# EAGLE design dice_2a (EAGLE 9.7.0)
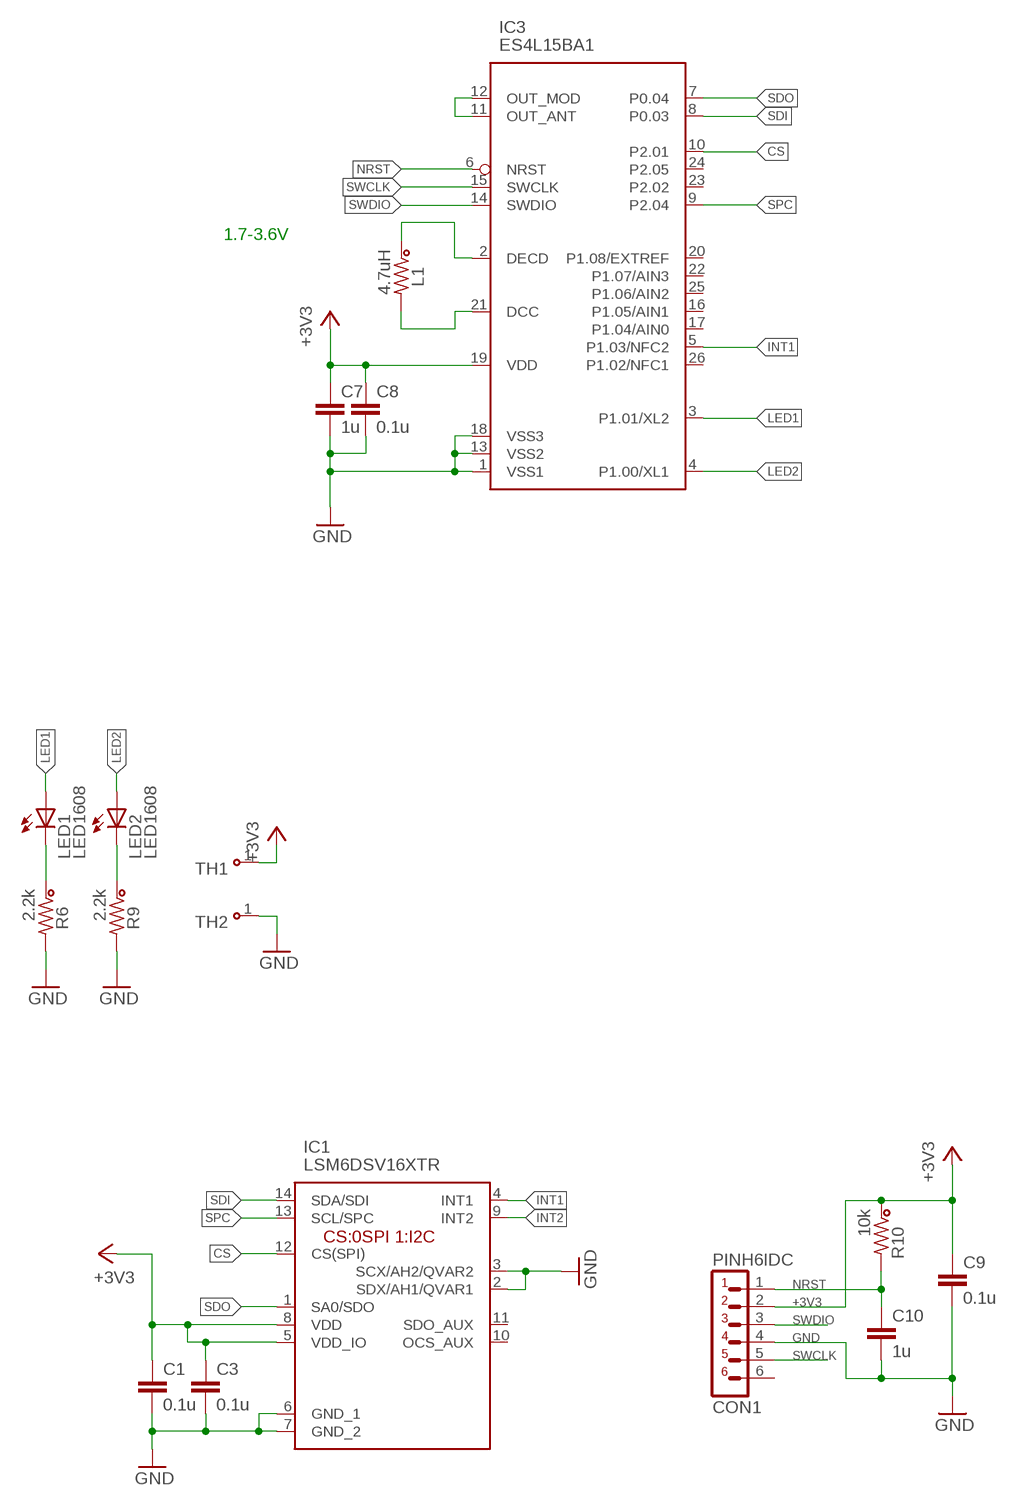
[diagram p0: schematic, sheet 1]

## Parts
C1  0.1u  C-CC1608A  [1608A]
C3  0.1u  C-CC1608A  [1608A]
C7  1u  C-CC1608A  [1608A]
C8  0.1u  C-CC1608A  [1608A]
C9  0.1u  C-CC1608A  [1608A]
C10  1u  C-CC1608A  [1608A]
CON1  PINH6IDC  [1X6IDC_1R27]
IC1  LSM6DSV16XTR  [LSM6DSV16BXTR]
IC3  ES4L15BA1  [ES4L15BA1]
L1  4.7uH  R-CC1608A  [1608A]
LED1  LED1608  [LED1608]
LED2  LED1608  [LED1608]
R6  2.2k  R-CC1608A  [1608A]
R9  2.2k  R-CC1608A  [1608A]
R10  10k  R-CC1608A  [1608A]
TH1  THCHK  [03C]
TH2  THCHK  [03C]

## Nets
+3V3: C1.1 C3.1 C7.1 C8.1 C9.1 CON1.2 IC1.5(VDD_IO) IC1.8(VDD) IC3.19(VDD) R10.1 TH1.1
CS: IC1.12(CS(SPI)) IC3.10(P2.01)
GND: C1.2 C3.2 C7.2 C8.2 C9.2 C10.2 CON1.4 IC1.2(SDX/AH1/QVAR1) IC1.3(SCX/AH2/QVAR2) IC1.6(GND_1) IC1.7(GND_2) IC3.1(VSS1) IC3.13(VSS2) IC3.18(VSS3) R6.2 R9.2 TH2.1
INT1: IC1.4(INT1) IC3.5(P1.03/NFC2)
INT2: IC1.9(INT2)
LED1: IC3.3(P1.01/XL2) LED1.A
LED2: IC3.4(P1.00/XL1) LED2.A
N$1: LED2.K(C) R9.1
N$2: IC3.11(OUT_ANT) IC3.12(OUT_MOD)
N$3: LED1.K(C) R6.1
N$4: IC3.2(DECD) L1.1
N$5: IC3.21(DCC) L1.2
NRST: C10.1 CON1.1 IC3.6(NRST) R10.2
SDI: IC1.14(SDA/SDI) IC3.8(P0.03)
SDO: IC1.1(SA0/SDO) IC3.7(P0.04)
SPC: IC1.13(SCL/SPC) IC3.9(P2.04)
SWCLK: CON1.5 IC3.15(SWCLK)
SWDIO: CON1.3 IC3.14(SWDIO)
Unconnected: CON1.6 IC1.10(OCS_AUX) IC1.11(SDO_AUX) IC3.16(P1.05/AIN1) IC3.17(P1.04/AIN0) IC3.20(P1.08/EXTREF) IC3.22(P1.07/AIN3) IC3.23(P2.02) IC3.24(P2.05) IC3.25(P1.06/AIN2) IC3.26(P1.02/NFC1)

## Notes on the sheet
- 1.7-3.6V

## Library data of the parts
C1 C3 C7-C10 = dac:C-CC
CON1 = dac:PINH6
IC1 = SamacSys_Parts:LSM6DSV16XTR: iNEMO 3D accelerometer and 3D gyroscope: always-on inertial module with embedded machine learning core and Qvar electrostatic sensor Source: Datasheet <https://www.st.com/resource/en/datasheet/lsm6dsv16x.pdf>; PARTS: LSM6DSV320XTR; SHOP: mouser
IC3 = SamacSys_Parts:ES4L15BA1: Board Mount Motion & Position Sensors 9-axis IMU Source: Datasheet <https://www.ceva-dsp.com/wp-content/uploads/2019/10/BNO080_085-Datasheet.pdf>
L1 = dac:R-CC; PARTS: LSQPB160807T4R7M
LED1 LED2 = dac:LED: LED rectangle, 5.7 x 3.2 mm
R6 R9 R10 = dac:R-CC
TH1 TH2 = dac:TH

## Board
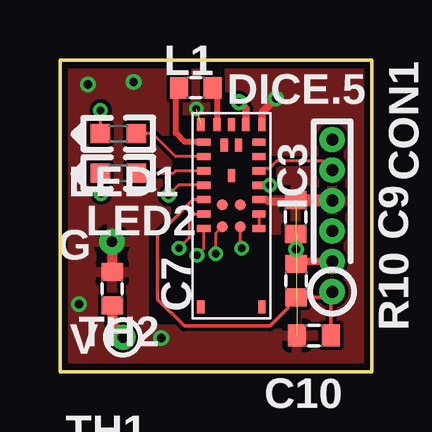
[diagram p1: board, top side]
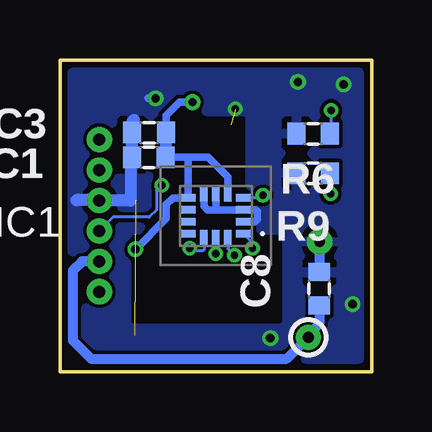
[diagram p2: board, bottom side, seen from below]

Size 13 x 13 mm. Coordinates in mm from the lower left corner, seen from the top.
Outline: 0,0 0,13 13,13 13,0 0,0
Copper layers (1*16): Top / Bottom
Stack-up Default Layer Stack: Top User Defined 0.035mm / Dielectric-1 User Defined 1.5mm / Bottom User Defined 0.035mm
Design rules: minimum copper width 4mil, minimum drill size 12mil, copper clearance wire_polygon to wire_polygon 6mil, copper clearance wire_polygon to pad_smd 6mil, copper clearance wire_polygon to via 6mil, copper clearance pad_smd to pad_smd 6mil, copper clearance pad_smd to via 6mil, copper clearance via to via 6mil, copper clearance smd to pad (same net) 0mil, copper clearance smd to via (same net) 0mil, copper clearance smd to smd (same net) 0mil, dimension clearance 10mil, via restrict clearance 0mil, drill distance 10mil, keepout clearance 0mil
RestrictCopper: area 5.4,2.4 to 8.7,10.6; area 3.8,2.1 to 9.9,5.6; area 3.8,2.1 to 9.9,5.6; 1 lines

### Footprints (pad centres in the part's own frame; a part is rotated, then mirrored left to right if it is on the bottom)
1608A = smd 0.75 x 0.9: 1 -0.7,0; 2 0.7,0
1X6IDC_1R27 = drill 0.5 pad 1.05: 1 -3.81,0; 2 -2.54,0; 3 -1.27,0; 4 0,0; 5 1.27,0; 6 2.54,0
LSM6DSV16BXTR = smd 0.6 x 0.3: 1 -1.15,0.75; 2 -1.15,0.25; 3 -1.15,-0.25; 4 -1.15,-0.75; 8 1.15,-0.75; 9 1.15,-0.25; 10 1.15,0.25; 11 1.15,0.75 | smd 0.3 x 0.6: 5 -0.5,-0.9; 6 0,-0.9; 7 0.5,-0.9; 12 0.5,0.9; 13 0,0.9; 14 -0.5,0.9
ES4L15BA1 = smd 0.55 x 0.3: 1 -3.8,-1.275; 18 -3.8,1.275; 19 -3.8,0.6; 20 -3.8,0; 21 -3.8,-0.6; 22 -2.95,-0.3; 25 -2.95,0.3; 26 -1.675,0; 27 3.8,-1.275; 28 3.8,1.275 | smd 0.3 x 0.55: 2 -3.075,-1.15; 3 -2.475,-1.15; 4 -1.875,-1.15; 5 -1.275,-1.15; 6 -0.675,-1.15; 7 -0.075,-1.15; 8 0.525,-1.15; 11 0.525,1.15; 12 -0.075,1.15; 13 -0.675,1.15; 14 -1.275,1.15; 15 -1.875,1.15; 16 -2.475,1.15; 17 -3.075,1.15 | smd 0.45 x 0.45: 9 0.45,-0.375; 10 0.45,0.375; 23 -0.45,-0.375; 24 -0.45,0.375
LED1608 = smd 0.8 x 0.8: A -0.75,0; K 0.75,0
03C = drill 0.45 pad 1.05: 1 0,0

### Placement (x,y rotation side)
C1  9.29,8.94 180 bottom
C3  9.28,9.97 180 bottom
C7  2.18,3.45 90 top
C8  2.18,3.45 90 bottom
C9  9.84,6.45 90 top
C10  10.59,1.51 180 top
CON1  11.36,7.14 90 top
IC1  6.5,6.5 180 bottom
IC3  7.15,6.5 270 top
L1  5.66,11.84 0 top
LED1  2.44,9.93 180 top
LED2  2.44,8.28 180 top
R6  2.44,9.93 180 bottom
R9  2.44,8.28 180 bottom
R10  9.85,3.8 270 top
TH1  2.64,1.43 0 top
TH2  2.17,5.42 0 top

### Tracks (layer width: path | path; a pad name or v marks a point on that pad's centre or on a via)
+3V3  (via drill 0.35)
  Top 0.305: C9.1 9.85,5.74 v9.85,5.1 R10.1 9.95,4.6 CON1.2 | IC3.19 7.75,10.96 v7.47,11.24
  Top 0.406: C8.1 2.18,1.99 2.64,1.53 TH1.1
  Bottom 0.305: C3.1 8.58,10.67 8.01,11.24 v7.47,11.24 | IC1.5 6,8.11 6.83,8.94 C1.1 7.65,8.94 IC1.8 8.29,7.25 8.57,6.97 8.57,6.38 v9.85,5.1
  Bottom 0.406: CON1.2 12.08,4.6 12.47,4.21 12.47,1.29 11.71,0.53 3.54,0.53 TH1.1 2.64,1.54 2.18,2 C8.1
  Bottom 0.508: C3.1 C1.1
CS  (via drill 0.3)
  Top 0.127: v7.58,5.14 7.53,5.2 IC3.10
  Bottom 0.127: IC1.12 7,5.08 7.04,5.04 7.48,5.04 v7.58,5.14
GND  (via drill 0.3, 0.35)  (2 unrouted)
  Top 0.305: IC3.18 8.43,10.8 v9.01,11.39 | IC3.13 8.61,7.17 8.69,7.09 9.79,7.09 C9.2
  Top 0.406: TH2.1 2.17,4.17 C8.2
  Top 0.508: CON1.4 C9.2
  Bottom 0.305: v9.01,11.39 9.31,11.39 9.33,11.41 | IC1.2 4.89,6.25 4.77,6.37 4.77,6.67 4.85,6.75 IC1.3 6.5,6.75 | 6.5,6.75 6.84,6.75 7,6.91 IC1.7 | IC1.6 6.5,6.75
  Bottom 0.406: TH2.1 2.17,4.17 C8.2
  Bottom 0.508: 9.91,10.49 9.98,10.42 C3.2 C1.2 10.06,8.87 10.06,7.13 11.35,7.13 CON1.4 12.32,7.15
  other vias: 3.07,12.09 5.68,10.95 1.16,11.98 0.79,2.81 4.22,1.4
  pour Top (isolate 0.1): 13.18,13.18 -0.18,13.18 -0.18,-0.18 13.18,-0.18
  pour Bottom (isolate 0.1): 13.18,13.18 -0.18,13.18 -0.18,-0.18 13.18,-0.18
INT1  (via drill 0.3)
  Top 0.127: IC3.5 4.96,7.78 v4.53,7.35
  Bottom 0.102: IC1.4 5.21,7.25 5.17,7.29
  Bottom 0.127: v4.53,7.35 4.63,7.25 IC1.4
LED1
  Top 0.127: IC3.3 4.81,8.97 3.86,9.93 LED1.A
LED2
  Top 0.127: IC3.4 4.81,8.38 4.7,8.26 3.2,8.26 LED2.A
N$1  (via drill 0.3)
  Top 0.127: v1.71,7.42 1.71,8.25 LED2.K
  Bottom 0.127: R9.1 1.74,7.45 v1.71,7.42
N$2
  Top 0.127: IC3.12 IC3.11
N$3  (via drill 0.3)
  Top 0.127: LED1.K v1.69,10.9
  Bottom 0.127: v1.69,10.9 1.69,9.97 R6.1
N$4
  Top 0.254: IC3.2 5.21,9.57 4.84,9.94 4.84,11.72 L1.1
N$5
  Top 0.254: L1.2 6.55,11.65 IC3.21
NRST
  Top 0.152: C10.1 11.29,3.27 CON1.1 11.12,3.1 R10.2 9.51,2.76 9.51,2.66 8.75,1.9 5.19,1.9 4.07,3.02 4.07,5.69 4.67,6.29 5.55,7.17 IC3.6
SDI  (via drill 0.3)
  Top 0.127: v5.72,4.86 6,5.14 IC3.8
  Bottom 0.127: IC1.14 6,5.12 5.74,4.86 v5.72,4.86
SDO  (via drill 0.3)
  Top 0.127: v4.97,5.15 5.41,5.59 5.41,6.37 5.62,6.58 IC3.7
  Bottom 0.127: IC1.1 4.97,5.37 v4.97,5.15
SPC  (via drill 0.3)
  Top 0.127: v6.5,4.92 6.5,5.78 IC3.9
  Bottom 0.127: IC1.13 v6.5,4.92
SWCLK
  Top 0.127: 8.33,8.4 IC3.15 8.39,8.46 8.73,8.46 9.04,8.78 10.99,8.78 CON1.5
SWDIO  (via drill 0.3)
  Top 0.127: v8.75,7.78 IC3.14 | IC3.14
  Bottom 0.127: v8.75,7.78 8.97,7.55 8.97,6.75 | 8.97,6.75 8.97,6.74 | 8.97,6.75 9.28,6.44 10.79,6.44 CON1.3

### Text on the board
tPlace: DICE.5 | G | V